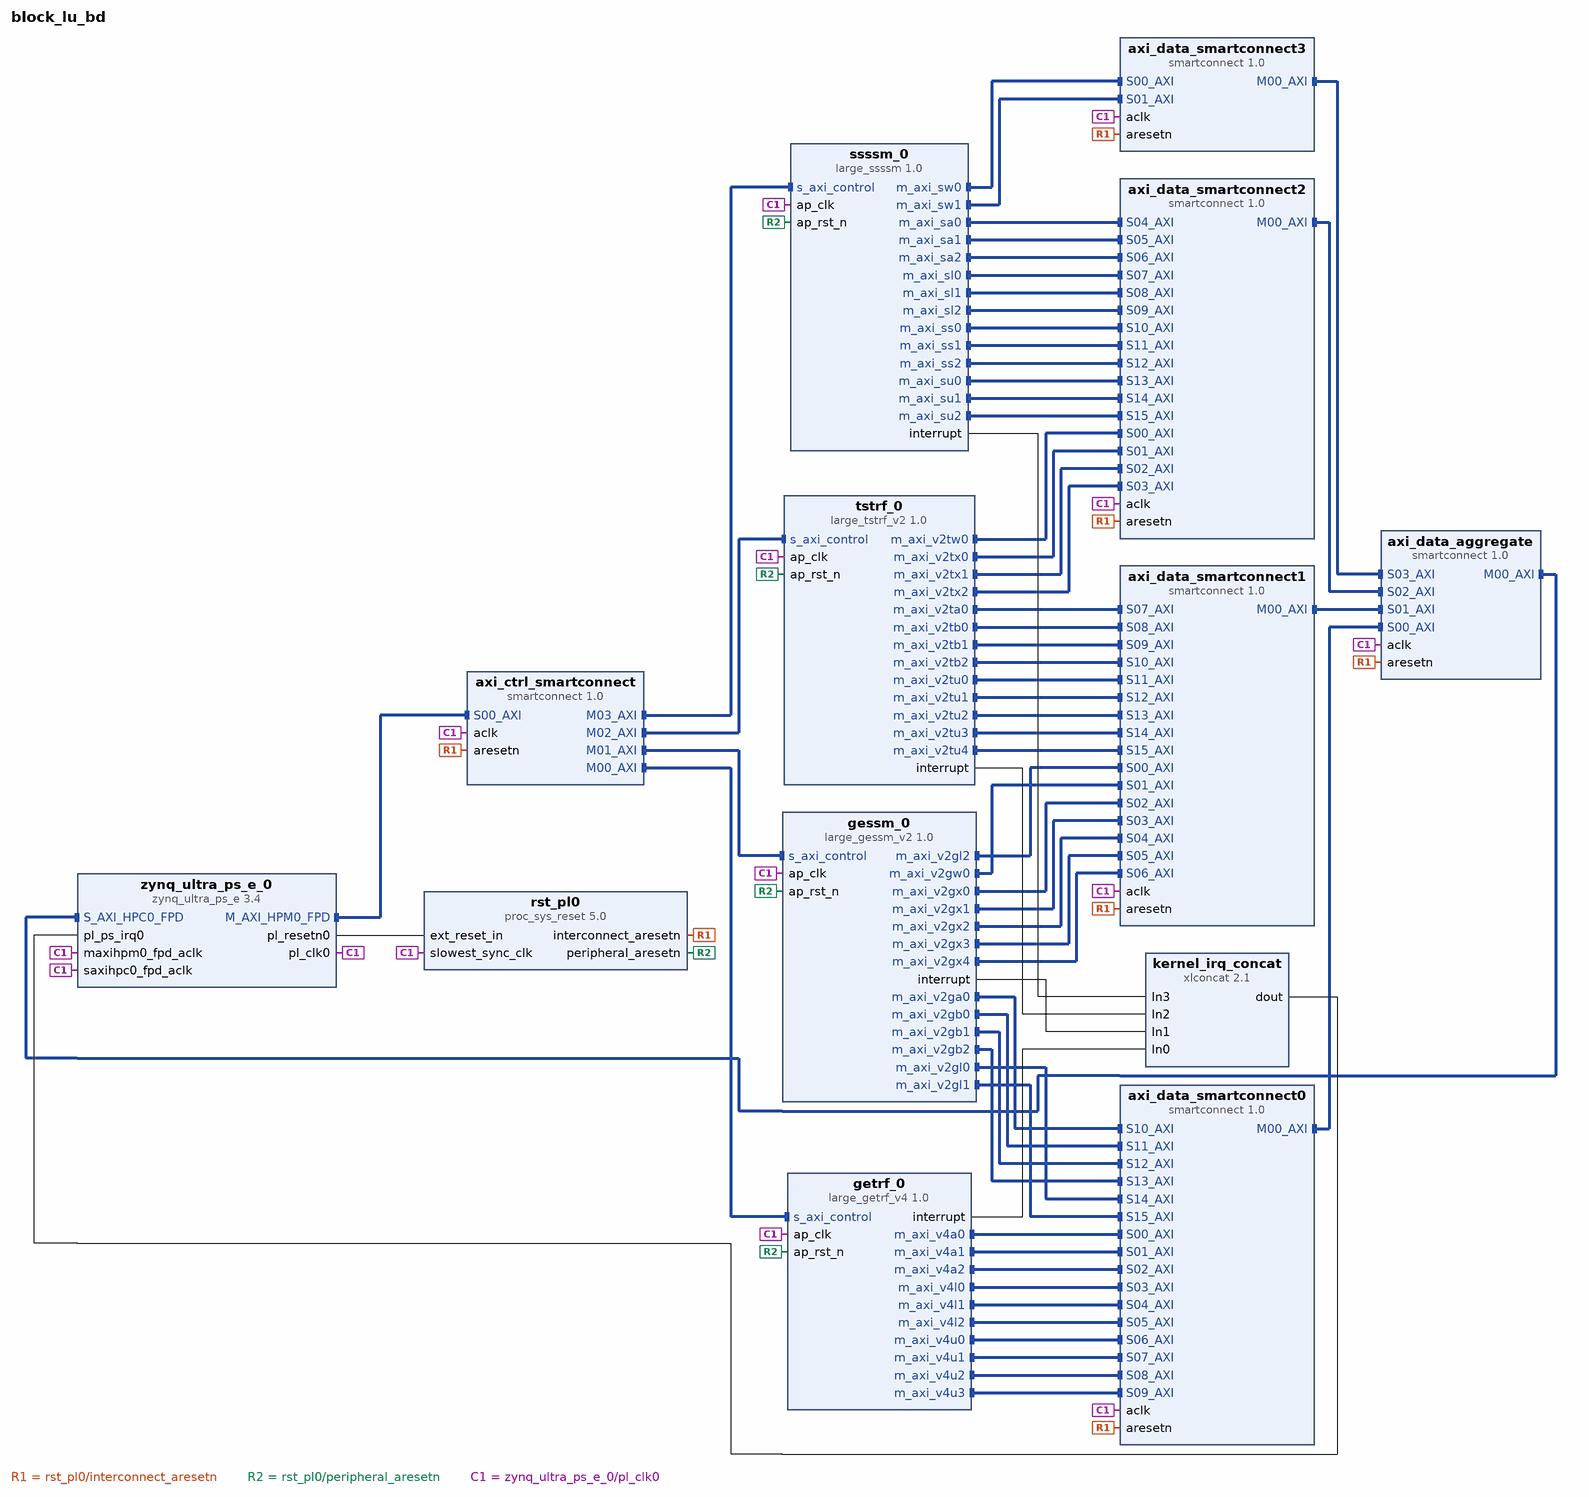
[diagram p0: block diagram of the top level]
# Vivado block design block_lu_bd, xczu15eg-ffvb1156-2-i, Vivado 2022.2
create_bd_design block_lu_bd

create_bd_cell -type ip -vlnv xilinx.com:ip:zynq_ultra_ps_e:3.4 zynq_ultra_ps_e_0
set_property -dict [list \
  CONFIG.PSU__CRL_APB__PL0_REF_CTRL__FREQMHZ 100 \
  CONFIG.PSU__DDR_HIGH_ADDRESS_GUI_ENABLE 0 \
  CONFIG.PSU__MAXIGP0__DATA_WIDTH 128 \
  CONFIG.PSU__UART0__BAUD_RATE 115200 \
  CONFIG.PSU__UART0__MODEM__ENABLE 0 \
  CONFIG.PSU__UART0__PERIPHERAL__ENABLE 1 \
  CONFIG.PSU__UART0__PERIPHERAL__IO {MIO 14 .. 15} \
  CONFIG.PSU__USE__IRQ0 1 \
  CONFIG.PSU__USE__M_AXI_GP0 1 \
  CONFIG.PSU__USE__M_AXI_GP1 0 \
  CONFIG.PSU__USE__M_AXI_GP2 0 \
  CONFIG.PSU__USE__S_AXI_GP0 1 \
] [get_bd_cells zynq_ultra_ps_e_0]
# 34 more settings of zynq_ultra_ps_e_0 are not shown: defaults, MIO pin electricals, DDR timing, and values the tool derives
create_bd_cell -type ip -vlnv xilinx.com:ip:proc_sys_reset:5.0 rst_pl0
create_bd_cell -type ip -vlnv xilinx.com:ip:smartconnect:1.0 axi_ctrl_smartconnect
set_property -dict {CONFIG.NUM_MI 4 CONFIG.NUM_SI 1} [get_bd_cells axi_ctrl_smartconnect]
create_bd_cell -type ip -vlnv xilinx.com:ip:smartconnect:1.0 axi_data_smartconnect0
set_property -dict {CONFIG.NUM_MI 1 CONFIG.NUM_SI 16} [get_bd_cells axi_data_smartconnect0]
create_bd_cell -type ip -vlnv xilinx.com:ip:smartconnect:1.0 axi_data_smartconnect1
set_property -dict {CONFIG.NUM_MI 1 CONFIG.NUM_SI 16} [get_bd_cells axi_data_smartconnect1]
create_bd_cell -type ip -vlnv xilinx.com:ip:smartconnect:1.0 axi_data_smartconnect2
set_property -dict {CONFIG.NUM_MI 1 CONFIG.NUM_SI 16} [get_bd_cells axi_data_smartconnect2]
create_bd_cell -type ip -vlnv xilinx.com:ip:smartconnect:1.0 axi_data_smartconnect3
set_property -dict {CONFIG.NUM_MI 1 CONFIG.NUM_SI 16} [get_bd_cells axi_data_smartconnect3]
create_bd_cell -type ip -vlnv xilinx.com:ip:smartconnect:1.0 axi_data_aggregate
set_property -dict {CONFIG.NUM_MI 1 CONFIG.NUM_SI 4} [get_bd_cells axi_data_aggregate]
create_bd_cell -type ip -vlnv xilinx.com:hls:large_getrf_v4:1.0 getrf_0
create_bd_cell -type ip -vlnv xilinx.com:hls:large_gessm_v2:1.0 gessm_0
create_bd_cell -type ip -vlnv xilinx.com:hls:large_tstrf_v2:1.0 tstrf_0
create_bd_cell -type ip -vlnv xilinx.com:hls:large_ssssm:1.0 ssssm_0
create_bd_cell -type ip -vlnv xilinx.com:ip:xlconcat:2.1 kernel_irq_concat
set_property -dict {CONFIG.NUM_PORTS 4} [get_bd_cells kernel_irq_concat]

# ---- connections ----

connect_bd_intf_net [get_bd_intf_pins axi_ctrl_smartconnect/M00_AXI] [get_bd_intf_pins getrf_0/s_axi_control]
connect_bd_intf_net [get_bd_intf_pins axi_ctrl_smartconnect/M01_AXI] [get_bd_intf_pins gessm_0/s_axi_control]
connect_bd_intf_net [get_bd_intf_pins axi_ctrl_smartconnect/M02_AXI] [get_bd_intf_pins tstrf_0/s_axi_control]
connect_bd_intf_net [get_bd_intf_pins axi_ctrl_smartconnect/M03_AXI] [get_bd_intf_pins ssssm_0/s_axi_control]
connect_bd_intf_net [get_bd_intf_pins axi_data_aggregate/M00_AXI] [get_bd_intf_pins zynq_ultra_ps_e_0/S_AXI_HPC0_FPD]
connect_bd_intf_net [get_bd_intf_pins axi_data_smartconnect0/M00_AXI] [get_bd_intf_pins axi_data_aggregate/S00_AXI]
connect_bd_intf_net [get_bd_intf_pins axi_data_smartconnect1/M00_AXI] [get_bd_intf_pins axi_data_aggregate/S01_AXI]
connect_bd_intf_net [get_bd_intf_pins axi_data_smartconnect2/M00_AXI] [get_bd_intf_pins axi_data_aggregate/S02_AXI]
connect_bd_intf_net [get_bd_intf_pins axi_data_smartconnect3/M00_AXI] [get_bd_intf_pins axi_data_aggregate/S03_AXI]
connect_bd_intf_net [get_bd_intf_pins axi_data_smartconnect0/S10_AXI] [get_bd_intf_pins gessm_0/m_axi_v2ga0]
connect_bd_intf_net [get_bd_intf_pins axi_data_smartconnect0/S11_AXI] [get_bd_intf_pins gessm_0/m_axi_v2gb0]
connect_bd_intf_net [get_bd_intf_pins axi_data_smartconnect0/S12_AXI] [get_bd_intf_pins gessm_0/m_axi_v2gb1]
connect_bd_intf_net [get_bd_intf_pins axi_data_smartconnect0/S13_AXI] [get_bd_intf_pins gessm_0/m_axi_v2gb2]
connect_bd_intf_net [get_bd_intf_pins axi_data_smartconnect0/S14_AXI] [get_bd_intf_pins gessm_0/m_axi_v2gl0]
connect_bd_intf_net [get_bd_intf_pins axi_data_smartconnect0/S15_AXI] [get_bd_intf_pins gessm_0/m_axi_v2gl1]
connect_bd_intf_net [get_bd_intf_pins axi_data_smartconnect1/S00_AXI] [get_bd_intf_pins gessm_0/m_axi_v2gl2]
connect_bd_intf_net [get_bd_intf_pins axi_data_smartconnect1/S01_AXI] [get_bd_intf_pins gessm_0/m_axi_v2gw0]
connect_bd_intf_net [get_bd_intf_pins axi_data_smartconnect1/S02_AXI] [get_bd_intf_pins gessm_0/m_axi_v2gx0]
connect_bd_intf_net [get_bd_intf_pins axi_data_smartconnect1/S03_AXI] [get_bd_intf_pins gessm_0/m_axi_v2gx1]
connect_bd_intf_net [get_bd_intf_pins axi_data_smartconnect1/S04_AXI] [get_bd_intf_pins gessm_0/m_axi_v2gx2]
connect_bd_intf_net [get_bd_intf_pins axi_data_smartconnect1/S05_AXI] [get_bd_intf_pins gessm_0/m_axi_v2gx3]
connect_bd_intf_net [get_bd_intf_pins axi_data_smartconnect1/S06_AXI] [get_bd_intf_pins gessm_0/m_axi_v2gx4]
connect_bd_intf_net [get_bd_intf_pins axi_data_smartconnect0/S00_AXI] [get_bd_intf_pins getrf_0/m_axi_v4a0]
connect_bd_intf_net [get_bd_intf_pins axi_data_smartconnect0/S01_AXI] [get_bd_intf_pins getrf_0/m_axi_v4a1]
connect_bd_intf_net [get_bd_intf_pins axi_data_smartconnect0/S02_AXI] [get_bd_intf_pins getrf_0/m_axi_v4a2]
connect_bd_intf_net [get_bd_intf_pins axi_data_smartconnect0/S03_AXI] [get_bd_intf_pins getrf_0/m_axi_v4l0]
connect_bd_intf_net [get_bd_intf_pins axi_data_smartconnect0/S04_AXI] [get_bd_intf_pins getrf_0/m_axi_v4l1]
connect_bd_intf_net [get_bd_intf_pins axi_data_smartconnect0/S05_AXI] [get_bd_intf_pins getrf_0/m_axi_v4l2]
connect_bd_intf_net [get_bd_intf_pins axi_data_smartconnect0/S06_AXI] [get_bd_intf_pins getrf_0/m_axi_v4u0]
connect_bd_intf_net [get_bd_intf_pins axi_data_smartconnect0/S07_AXI] [get_bd_intf_pins getrf_0/m_axi_v4u1]
connect_bd_intf_net [get_bd_intf_pins axi_data_smartconnect0/S08_AXI] [get_bd_intf_pins getrf_0/m_axi_v4u2]
connect_bd_intf_net [get_bd_intf_pins axi_data_smartconnect0/S09_AXI] [get_bd_intf_pins getrf_0/m_axi_v4u3]
connect_bd_intf_net [get_bd_intf_pins axi_data_smartconnect2/S04_AXI] [get_bd_intf_pins ssssm_0/m_axi_sa0]
connect_bd_intf_net [get_bd_intf_pins axi_data_smartconnect2/S05_AXI] [get_bd_intf_pins ssssm_0/m_axi_sa1]
connect_bd_intf_net [get_bd_intf_pins axi_data_smartconnect2/S06_AXI] [get_bd_intf_pins ssssm_0/m_axi_sa2]
connect_bd_intf_net [get_bd_intf_pins axi_data_smartconnect2/S07_AXI] [get_bd_intf_pins ssssm_0/m_axi_sl0]
connect_bd_intf_net [get_bd_intf_pins axi_data_smartconnect2/S08_AXI] [get_bd_intf_pins ssssm_0/m_axi_sl1]
connect_bd_intf_net [get_bd_intf_pins axi_data_smartconnect2/S09_AXI] [get_bd_intf_pins ssssm_0/m_axi_sl2]
connect_bd_intf_net [get_bd_intf_pins axi_data_smartconnect2/S10_AXI] [get_bd_intf_pins ssssm_0/m_axi_ss0]
connect_bd_intf_net [get_bd_intf_pins axi_data_smartconnect2/S11_AXI] [get_bd_intf_pins ssssm_0/m_axi_ss1]
connect_bd_intf_net [get_bd_intf_pins axi_data_smartconnect2/S12_AXI] [get_bd_intf_pins ssssm_0/m_axi_ss2]
connect_bd_intf_net [get_bd_intf_pins axi_data_smartconnect2/S13_AXI] [get_bd_intf_pins ssssm_0/m_axi_su0]
connect_bd_intf_net [get_bd_intf_pins axi_data_smartconnect2/S14_AXI] [get_bd_intf_pins ssssm_0/m_axi_su1]
connect_bd_intf_net [get_bd_intf_pins axi_data_smartconnect2/S15_AXI] [get_bd_intf_pins ssssm_0/m_axi_su2]
connect_bd_intf_net [get_bd_intf_pins axi_data_smartconnect3/S00_AXI] [get_bd_intf_pins ssssm_0/m_axi_sw0]
connect_bd_intf_net [get_bd_intf_pins axi_data_smartconnect3/S01_AXI] [get_bd_intf_pins ssssm_0/m_axi_sw1]
connect_bd_intf_net [get_bd_intf_pins axi_data_smartconnect1/S07_AXI] [get_bd_intf_pins tstrf_0/m_axi_v2ta0]
connect_bd_intf_net [get_bd_intf_pins axi_data_smartconnect1/S08_AXI] [get_bd_intf_pins tstrf_0/m_axi_v2tb0]
connect_bd_intf_net [get_bd_intf_pins axi_data_smartconnect1/S09_AXI] [get_bd_intf_pins tstrf_0/m_axi_v2tb1]
connect_bd_intf_net [get_bd_intf_pins axi_data_smartconnect1/S10_AXI] [get_bd_intf_pins tstrf_0/m_axi_v2tb2]
connect_bd_intf_net [get_bd_intf_pins axi_data_smartconnect1/S11_AXI] [get_bd_intf_pins tstrf_0/m_axi_v2tu0]
connect_bd_intf_net [get_bd_intf_pins axi_data_smartconnect1/S12_AXI] [get_bd_intf_pins tstrf_0/m_axi_v2tu1]
connect_bd_intf_net [get_bd_intf_pins axi_data_smartconnect1/S13_AXI] [get_bd_intf_pins tstrf_0/m_axi_v2tu2]
connect_bd_intf_net [get_bd_intf_pins axi_data_smartconnect1/S14_AXI] [get_bd_intf_pins tstrf_0/m_axi_v2tu3]
connect_bd_intf_net [get_bd_intf_pins axi_data_smartconnect1/S15_AXI] [get_bd_intf_pins tstrf_0/m_axi_v2tu4]
connect_bd_intf_net [get_bd_intf_pins axi_data_smartconnect2/S00_AXI] [get_bd_intf_pins tstrf_0/m_axi_v2tw0]
connect_bd_intf_net [get_bd_intf_pins axi_data_smartconnect2/S01_AXI] [get_bd_intf_pins tstrf_0/m_axi_v2tx0]
connect_bd_intf_net [get_bd_intf_pins axi_data_smartconnect2/S02_AXI] [get_bd_intf_pins tstrf_0/m_axi_v2tx1]
connect_bd_intf_net [get_bd_intf_pins axi_data_smartconnect2/S03_AXI] [get_bd_intf_pins tstrf_0/m_axi_v2tx2]
connect_bd_intf_net [get_bd_intf_pins zynq_ultra_ps_e_0/M_AXI_HPM0_FPD] [get_bd_intf_pins axi_ctrl_smartconnect/S00_AXI]
connect_bd_net [get_bd_pins gessm_0/interrupt] [get_bd_pins kernel_irq_concat/In1]
connect_bd_net [get_bd_pins getrf_0/interrupt] [get_bd_pins kernel_irq_concat/In0]
connect_bd_net [get_bd_pins kernel_irq_concat/dout] [get_bd_pins zynq_ultra_ps_e_0/pl_ps_irq0]
connect_bd_net [get_bd_pins rst_pl0/interconnect_aresetn] \
  [get_bd_pins axi_ctrl_smartconnect/aresetn] [get_bd_pins axi_data_aggregate/aresetn] \
  [get_bd_pins axi_data_smartconnect0/aresetn] [get_bd_pins axi_data_smartconnect1/aresetn] \
  [get_bd_pins axi_data_smartconnect2/aresetn] [get_bd_pins axi_data_smartconnect3/aresetn]
connect_bd_net [get_bd_pins rst_pl0/peripheral_aresetn] \
  [get_bd_pins getrf_0/ap_rst_n] [get_bd_pins gessm_0/ap_rst_n] [get_bd_pins tstrf_0/ap_rst_n] [get_bd_pins ssssm_0/ap_rst_n]
connect_bd_net [get_bd_pins ssssm_0/interrupt] [get_bd_pins kernel_irq_concat/In3]
connect_bd_net [get_bd_pins tstrf_0/interrupt] [get_bd_pins kernel_irq_concat/In2]
connect_bd_net [get_bd_pins zynq_ultra_ps_e_0/pl_clk0] \
  [get_bd_pins rst_pl0/slowest_sync_clk] [get_bd_pins getrf_0/ap_clk] [get_bd_pins gessm_0/ap_clk] \
  [get_bd_pins tstrf_0/ap_clk] [get_bd_pins ssssm_0/ap_clk] [get_bd_pins axi_ctrl_smartconnect/aclk] \
  [get_bd_pins zynq_ultra_ps_e_0/maxihpm0_fpd_aclk] [get_bd_pins zynq_ultra_ps_e_0/saxihpc0_fpd_aclk] \
  [get_bd_pins axi_data_aggregate/aclk] [get_bd_pins axi_data_smartconnect0/aclk] [get_bd_pins axi_data_smartconnect1/aclk] \
  [get_bd_pins axi_data_smartconnect2/aclk] [get_bd_pins axi_data_smartconnect3/aclk]
connect_bd_net [get_bd_pins zynq_ultra_ps_e_0/pl_resetn0] [get_bd_pins rst_pl0/ext_reset_in]

# ---- address map ----
assign_bd_address -offset 0x0000000000000000 -range 2G -target_address_space [get_bd_addr_spaces gessm_0/m_axi_v2ga0] [get_bd_addr_segs zynq_ultra_ps_e_0/SAXIGP0/HPC0_DDR_LOW]
assign_bd_address -offset 0x00000000FF000000 -range 16M -target_address_space [get_bd_addr_spaces gessm_0/m_axi_v2ga0] [get_bd_addr_segs zynq_ultra_ps_e_0/SAXIGP0/HPC0_LPS_OCM]
assign_bd_address -offset 0x0000000000000000 -range 2G -target_address_space [get_bd_addr_spaces gessm_0/m_axi_v2gb0] [get_bd_addr_segs zynq_ultra_ps_e_0/SAXIGP0/HPC0_DDR_LOW]
assign_bd_address -offset 0x00000000FF000000 -range 16M -target_address_space [get_bd_addr_spaces gessm_0/m_axi_v2gb0] [get_bd_addr_segs zynq_ultra_ps_e_0/SAXIGP0/HPC0_LPS_OCM]
assign_bd_address -offset 0x0000000000000000 -range 2G -target_address_space [get_bd_addr_spaces gessm_0/m_axi_v2gb1] [get_bd_addr_segs zynq_ultra_ps_e_0/SAXIGP0/HPC0_DDR_LOW]
assign_bd_address -offset 0x00000000FF000000 -range 16M -target_address_space [get_bd_addr_spaces gessm_0/m_axi_v2gb1] [get_bd_addr_segs zynq_ultra_ps_e_0/SAXIGP0/HPC0_LPS_OCM]
assign_bd_address -offset 0x0000000000000000 -range 2G -target_address_space [get_bd_addr_spaces gessm_0/m_axi_v2gb2] [get_bd_addr_segs zynq_ultra_ps_e_0/SAXIGP0/HPC0_DDR_LOW]
assign_bd_address -offset 0x00000000FF000000 -range 16M -target_address_space [get_bd_addr_spaces gessm_0/m_axi_v2gb2] [get_bd_addr_segs zynq_ultra_ps_e_0/SAXIGP0/HPC0_LPS_OCM]
assign_bd_address -offset 0x0000000000000000 -range 2G -target_address_space [get_bd_addr_spaces gessm_0/m_axi_v2gl0] [get_bd_addr_segs zynq_ultra_ps_e_0/SAXIGP0/HPC0_DDR_LOW]
assign_bd_address -offset 0x00000000FF000000 -range 16M -target_address_space [get_bd_addr_spaces gessm_0/m_axi_v2gl0] [get_bd_addr_segs zynq_ultra_ps_e_0/SAXIGP0/HPC0_LPS_OCM]
assign_bd_address -offset 0x0000000000000000 -range 2G -target_address_space [get_bd_addr_spaces gessm_0/m_axi_v2gl1] [get_bd_addr_segs zynq_ultra_ps_e_0/SAXIGP0/HPC0_DDR_LOW]
assign_bd_address -offset 0x00000000FF000000 -range 16M -target_address_space [get_bd_addr_spaces gessm_0/m_axi_v2gl1] [get_bd_addr_segs zynq_ultra_ps_e_0/SAXIGP0/HPC0_LPS_OCM]
assign_bd_address -offset 0x0000000000000000 -range 2G -target_address_space [get_bd_addr_spaces gessm_0/m_axi_v2gl2] [get_bd_addr_segs zynq_ultra_ps_e_0/SAXIGP0/HPC0_DDR_LOW]
assign_bd_address -offset 0x00000000FF000000 -range 16M -target_address_space [get_bd_addr_spaces gessm_0/m_axi_v2gl2] [get_bd_addr_segs zynq_ultra_ps_e_0/SAXIGP0/HPC0_LPS_OCM]
assign_bd_address -offset 0x0000000000000000 -range 2G -target_address_space [get_bd_addr_spaces gessm_0/m_axi_v2gw0] [get_bd_addr_segs zynq_ultra_ps_e_0/SAXIGP0/HPC0_DDR_LOW]
assign_bd_address -offset 0x00000000FF000000 -range 16M -target_address_space [get_bd_addr_spaces gessm_0/m_axi_v2gw0] [get_bd_addr_segs zynq_ultra_ps_e_0/SAXIGP0/HPC0_LPS_OCM]
assign_bd_address -offset 0x0000000000000000 -range 2G -target_address_space [get_bd_addr_spaces gessm_0/m_axi_v2gx0] [get_bd_addr_segs zynq_ultra_ps_e_0/SAXIGP0/HPC0_DDR_LOW]
assign_bd_address -offset 0x00000000FF000000 -range 16M -target_address_space [get_bd_addr_spaces gessm_0/m_axi_v2gx0] [get_bd_addr_segs zynq_ultra_ps_e_0/SAXIGP0/HPC0_LPS_OCM]
assign_bd_address -offset 0x0000000000000000 -range 2G -target_address_space [get_bd_addr_spaces gessm_0/m_axi_v2gx1] [get_bd_addr_segs zynq_ultra_ps_e_0/SAXIGP0/HPC0_DDR_LOW]
assign_bd_address -offset 0x00000000FF000000 -range 16M -target_address_space [get_bd_addr_spaces gessm_0/m_axi_v2gx1] [get_bd_addr_segs zynq_ultra_ps_e_0/SAXIGP0/HPC0_LPS_OCM]
assign_bd_address -offset 0x0000000000000000 -range 2G -target_address_space [get_bd_addr_spaces gessm_0/m_axi_v2gx2] [get_bd_addr_segs zynq_ultra_ps_e_0/SAXIGP0/HPC0_DDR_LOW]
assign_bd_address -offset 0x00000000FF000000 -range 16M -target_address_space [get_bd_addr_spaces gessm_0/m_axi_v2gx2] [get_bd_addr_segs zynq_ultra_ps_e_0/SAXIGP0/HPC0_LPS_OCM]
assign_bd_address -offset 0x0000000000000000 -range 2G -target_address_space [get_bd_addr_spaces gessm_0/m_axi_v2gx3] [get_bd_addr_segs zynq_ultra_ps_e_0/SAXIGP0/HPC0_DDR_LOW]
assign_bd_address -offset 0x00000000FF000000 -range 16M -target_address_space [get_bd_addr_spaces gessm_0/m_axi_v2gx3] [get_bd_addr_segs zynq_ultra_ps_e_0/SAXIGP0/HPC0_LPS_OCM]
assign_bd_address -offset 0x0000000000000000 -range 2G -target_address_space [get_bd_addr_spaces gessm_0/m_axi_v2gx4] [get_bd_addr_segs zynq_ultra_ps_e_0/SAXIGP0/HPC0_DDR_LOW]
assign_bd_address -offset 0x00000000FF000000 -range 16M -target_address_space [get_bd_addr_spaces gessm_0/m_axi_v2gx4] [get_bd_addr_segs zynq_ultra_ps_e_0/SAXIGP0/HPC0_LPS_OCM]
assign_bd_address -offset 0x0000000000000000 -range 2G -target_address_space [get_bd_addr_spaces getrf_0/m_axi_v4a0] [get_bd_addr_segs zynq_ultra_ps_e_0/SAXIGP0/HPC0_DDR_LOW]
assign_bd_address -offset 0x00000000FF000000 -range 16M -target_address_space [get_bd_addr_spaces getrf_0/m_axi_v4a0] [get_bd_addr_segs zynq_ultra_ps_e_0/SAXIGP0/HPC0_LPS_OCM]
assign_bd_address -offset 0x0000000000000000 -range 2G -target_address_space [get_bd_addr_spaces getrf_0/m_axi_v4a1] [get_bd_addr_segs zynq_ultra_ps_e_0/SAXIGP0/HPC0_DDR_LOW]
assign_bd_address -offset 0x00000000FF000000 -range 16M -target_address_space [get_bd_addr_spaces getrf_0/m_axi_v4a1] [get_bd_addr_segs zynq_ultra_ps_e_0/SAXIGP0/HPC0_LPS_OCM]
assign_bd_address -offset 0x0000000000000000 -range 2G -target_address_space [get_bd_addr_spaces getrf_0/m_axi_v4a2] [get_bd_addr_segs zynq_ultra_ps_e_0/SAXIGP0/HPC0_DDR_LOW]
assign_bd_address -offset 0x00000000FF000000 -range 16M -target_address_space [get_bd_addr_spaces getrf_0/m_axi_v4a2] [get_bd_addr_segs zynq_ultra_ps_e_0/SAXIGP0/HPC0_LPS_OCM]
assign_bd_address -offset 0x0000000000000000 -range 2G -target_address_space [get_bd_addr_spaces getrf_0/m_axi_v4l0] [get_bd_addr_segs zynq_ultra_ps_e_0/SAXIGP0/HPC0_DDR_LOW]
assign_bd_address -offset 0x00000000FF000000 -range 16M -target_address_space [get_bd_addr_spaces getrf_0/m_axi_v4l0] [get_bd_addr_segs zynq_ultra_ps_e_0/SAXIGP0/HPC0_LPS_OCM]
assign_bd_address -offset 0x0000000000000000 -range 2G -target_address_space [get_bd_addr_spaces getrf_0/m_axi_v4l1] [get_bd_addr_segs zynq_ultra_ps_e_0/SAXIGP0/HPC0_DDR_LOW]
assign_bd_address -offset 0x00000000FF000000 -range 16M -target_address_space [get_bd_addr_spaces getrf_0/m_axi_v4l1] [get_bd_addr_segs zynq_ultra_ps_e_0/SAXIGP0/HPC0_LPS_OCM]
assign_bd_address -offset 0x0000000000000000 -range 2G -target_address_space [get_bd_addr_spaces getrf_0/m_axi_v4l2] [get_bd_addr_segs zynq_ultra_ps_e_0/SAXIGP0/HPC0_DDR_LOW]
assign_bd_address -offset 0x00000000FF000000 -range 16M -target_address_space [get_bd_addr_spaces getrf_0/m_axi_v4l2] [get_bd_addr_segs zynq_ultra_ps_e_0/SAXIGP0/HPC0_LPS_OCM]
assign_bd_address -offset 0x0000000000000000 -range 2G -target_address_space [get_bd_addr_spaces getrf_0/m_axi_v4u0] [get_bd_addr_segs zynq_ultra_ps_e_0/SAXIGP0/HPC0_DDR_LOW]
assign_bd_address -offset 0x00000000FF000000 -range 16M -target_address_space [get_bd_addr_spaces getrf_0/m_axi_v4u0] [get_bd_addr_segs zynq_ultra_ps_e_0/SAXIGP0/HPC0_LPS_OCM]
assign_bd_address -offset 0x0000000000000000 -range 2G -target_address_space [get_bd_addr_spaces getrf_0/m_axi_v4u1] [get_bd_addr_segs zynq_ultra_ps_e_0/SAXIGP0/HPC0_DDR_LOW]
assign_bd_address -offset 0x00000000FF000000 -range 16M -target_address_space [get_bd_addr_spaces getrf_0/m_axi_v4u1] [get_bd_addr_segs zynq_ultra_ps_e_0/SAXIGP0/HPC0_LPS_OCM]
assign_bd_address -offset 0x0000000000000000 -range 2G -target_address_space [get_bd_addr_spaces getrf_0/m_axi_v4u2] [get_bd_addr_segs zynq_ultra_ps_e_0/SAXIGP0/HPC0_DDR_LOW]
assign_bd_address -offset 0x00000000FF000000 -range 16M -target_address_space [get_bd_addr_spaces getrf_0/m_axi_v4u2] [get_bd_addr_segs zynq_ultra_ps_e_0/SAXIGP0/HPC0_LPS_OCM]
assign_bd_address -offset 0x0000000000000000 -range 2G -target_address_space [get_bd_addr_spaces getrf_0/m_axi_v4u3] [get_bd_addr_segs zynq_ultra_ps_e_0/SAXIGP0/HPC0_DDR_LOW]
assign_bd_address -offset 0x00000000FF000000 -range 16M -target_address_space [get_bd_addr_spaces getrf_0/m_axi_v4u3] [get_bd_addr_segs zynq_ultra_ps_e_0/SAXIGP0/HPC0_LPS_OCM]
assign_bd_address -offset 0x0000000000000000 -range 2G -target_address_space [get_bd_addr_spaces ssssm_0/m_axi_sa0] [get_bd_addr_segs zynq_ultra_ps_e_0/SAXIGP0/HPC0_DDR_LOW]
assign_bd_address -offset 0x00000000FF000000 -range 16M -target_address_space [get_bd_addr_spaces ssssm_0/m_axi_sa0] [get_bd_addr_segs zynq_ultra_ps_e_0/SAXIGP0/HPC0_LPS_OCM]
assign_bd_address -offset 0x0000000000000000 -range 2G -target_address_space [get_bd_addr_spaces ssssm_0/m_axi_sa1] [get_bd_addr_segs zynq_ultra_ps_e_0/SAXIGP0/HPC0_DDR_LOW]
assign_bd_address -offset 0x00000000FF000000 -range 16M -target_address_space [get_bd_addr_spaces ssssm_0/m_axi_sa1] [get_bd_addr_segs zynq_ultra_ps_e_0/SAXIGP0/HPC0_LPS_OCM]
assign_bd_address -offset 0x0000000000000000 -range 2G -target_address_space [get_bd_addr_spaces ssssm_0/m_axi_sa2] [get_bd_addr_segs zynq_ultra_ps_e_0/SAXIGP0/HPC0_DDR_LOW]
assign_bd_address -offset 0x00000000FF000000 -range 16M -target_address_space [get_bd_addr_spaces ssssm_0/m_axi_sa2] [get_bd_addr_segs zynq_ultra_ps_e_0/SAXIGP0/HPC0_LPS_OCM]
assign_bd_address -offset 0x0000000000000000 -range 2G -target_address_space [get_bd_addr_spaces ssssm_0/m_axi_sl0] [get_bd_addr_segs zynq_ultra_ps_e_0/SAXIGP0/HPC0_DDR_LOW]
assign_bd_address -offset 0x00000000FF000000 -range 16M -target_address_space [get_bd_addr_spaces ssssm_0/m_axi_sl0] [get_bd_addr_segs zynq_ultra_ps_e_0/SAXIGP0/HPC0_LPS_OCM]
assign_bd_address -offset 0x0000000000000000 -range 2G -target_address_space [get_bd_addr_spaces ssssm_0/m_axi_sl1] [get_bd_addr_segs zynq_ultra_ps_e_0/SAXIGP0/HPC0_DDR_LOW]
assign_bd_address -offset 0x00000000FF000000 -range 16M -target_address_space [get_bd_addr_spaces ssssm_0/m_axi_sl1] [get_bd_addr_segs zynq_ultra_ps_e_0/SAXIGP0/HPC0_LPS_OCM]
assign_bd_address -offset 0x0000000000000000 -range 2G -target_address_space [get_bd_addr_spaces ssssm_0/m_axi_sl2] [get_bd_addr_segs zynq_ultra_ps_e_0/SAXIGP0/HPC0_DDR_LOW]
assign_bd_address -offset 0x00000000FF000000 -range 16M -target_address_space [get_bd_addr_spaces ssssm_0/m_axi_sl2] [get_bd_addr_segs zynq_ultra_ps_e_0/SAXIGP0/HPC0_LPS_OCM]
assign_bd_address -offset 0x0000000000000000 -range 2G -target_address_space [get_bd_addr_spaces ssssm_0/m_axi_ss0] [get_bd_addr_segs zynq_ultra_ps_e_0/SAXIGP0/HPC0_DDR_LOW]
assign_bd_address -offset 0x00000000FF000000 -range 16M -target_address_space [get_bd_addr_spaces ssssm_0/m_axi_ss0] [get_bd_addr_segs zynq_ultra_ps_e_0/SAXIGP0/HPC0_LPS_OCM]
assign_bd_address -offset 0x0000000000000000 -range 2G -target_address_space [get_bd_addr_spaces ssssm_0/m_axi_ss1] [get_bd_addr_segs zynq_ultra_ps_e_0/SAXIGP0/HPC0_DDR_LOW]
assign_bd_address -offset 0x00000000FF000000 -range 16M -target_address_space [get_bd_addr_spaces ssssm_0/m_axi_ss1] [get_bd_addr_segs zynq_ultra_ps_e_0/SAXIGP0/HPC0_LPS_OCM]
assign_bd_address -offset 0x0000000000000000 -range 2G -target_address_space [get_bd_addr_spaces ssssm_0/m_axi_ss2] [get_bd_addr_segs zynq_ultra_ps_e_0/SAXIGP0/HPC0_DDR_LOW]
assign_bd_address -offset 0x00000000FF000000 -range 16M -target_address_space [get_bd_addr_spaces ssssm_0/m_axi_ss2] [get_bd_addr_segs zynq_ultra_ps_e_0/SAXIGP0/HPC0_LPS_OCM]
assign_bd_address -offset 0x0000000000000000 -range 2G -target_address_space [get_bd_addr_spaces ssssm_0/m_axi_su0] [get_bd_addr_segs zynq_ultra_ps_e_0/SAXIGP0/HPC0_DDR_LOW]
assign_bd_address -offset 0x00000000FF000000 -range 16M -target_address_space [get_bd_addr_spaces ssssm_0/m_axi_su0] [get_bd_addr_segs zynq_ultra_ps_e_0/SAXIGP0/HPC0_LPS_OCM]
assign_bd_address -offset 0x0000000000000000 -range 2G -target_address_space [get_bd_addr_spaces ssssm_0/m_axi_su1] [get_bd_addr_segs zynq_ultra_ps_e_0/SAXIGP0/HPC0_DDR_LOW]
assign_bd_address -offset 0x00000000FF000000 -range 16M -target_address_space [get_bd_addr_spaces ssssm_0/m_axi_su1] [get_bd_addr_segs zynq_ultra_ps_e_0/SAXIGP0/HPC0_LPS_OCM]
assign_bd_address -offset 0x0000000000000000 -range 2G -target_address_space [get_bd_addr_spaces ssssm_0/m_axi_su2] [get_bd_addr_segs zynq_ultra_ps_e_0/SAXIGP0/HPC0_DDR_LOW]
assign_bd_address -offset 0x00000000FF000000 -range 16M -target_address_space [get_bd_addr_spaces ssssm_0/m_axi_su2] [get_bd_addr_segs zynq_ultra_ps_e_0/SAXIGP0/HPC0_LPS_OCM]
assign_bd_address -offset 0x0000000000000000 -range 2G -target_address_space [get_bd_addr_spaces ssssm_0/m_axi_sw0] [get_bd_addr_segs zynq_ultra_ps_e_0/SAXIGP0/HPC0_DDR_LOW]
assign_bd_address -offset 0x00000000FF000000 -range 16M -target_address_space [get_bd_addr_spaces ssssm_0/m_axi_sw0] [get_bd_addr_segs zynq_ultra_ps_e_0/SAXIGP0/HPC0_LPS_OCM]
assign_bd_address -offset 0x0000000000000000 -range 2G -target_address_space [get_bd_addr_spaces ssssm_0/m_axi_sw1] [get_bd_addr_segs zynq_ultra_ps_e_0/SAXIGP0/HPC0_DDR_LOW]
assign_bd_address -offset 0x00000000FF000000 -range 16M -target_address_space [get_bd_addr_spaces ssssm_0/m_axi_sw1] [get_bd_addr_segs zynq_ultra_ps_e_0/SAXIGP0/HPC0_LPS_OCM]
assign_bd_address -offset 0x0000000000000000 -range 2G -target_address_space [get_bd_addr_spaces tstrf_0/m_axi_v2ta0] [get_bd_addr_segs zynq_ultra_ps_e_0/SAXIGP0/HPC0_DDR_LOW]
assign_bd_address -offset 0x00000000FF000000 -range 16M -target_address_space [get_bd_addr_spaces tstrf_0/m_axi_v2ta0] [get_bd_addr_segs zynq_ultra_ps_e_0/SAXIGP0/HPC0_LPS_OCM]
assign_bd_address -offset 0x0000000000000000 -range 2G -target_address_space [get_bd_addr_spaces tstrf_0/m_axi_v2tb0] [get_bd_addr_segs zynq_ultra_ps_e_0/SAXIGP0/HPC0_DDR_LOW]
assign_bd_address -offset 0x00000000FF000000 -range 16M -target_address_space [get_bd_addr_spaces tstrf_0/m_axi_v2tb0] [get_bd_addr_segs zynq_ultra_ps_e_0/SAXIGP0/HPC0_LPS_OCM]
assign_bd_address -offset 0x0000000000000000 -range 2G -target_address_space [get_bd_addr_spaces tstrf_0/m_axi_v2tb1] [get_bd_addr_segs zynq_ultra_ps_e_0/SAXIGP0/HPC0_DDR_LOW]
assign_bd_address -offset 0x00000000FF000000 -range 16M -target_address_space [get_bd_addr_spaces tstrf_0/m_axi_v2tb1] [get_bd_addr_segs zynq_ultra_ps_e_0/SAXIGP0/HPC0_LPS_OCM]
assign_bd_address -offset 0x0000000000000000 -range 2G -target_address_space [get_bd_addr_spaces tstrf_0/m_axi_v2tb2] [get_bd_addr_segs zynq_ultra_ps_e_0/SAXIGP0/HPC0_DDR_LOW]
assign_bd_address -offset 0x00000000FF000000 -range 16M -target_address_space [get_bd_addr_spaces tstrf_0/m_axi_v2tb2] [get_bd_addr_segs zynq_ultra_ps_e_0/SAXIGP0/HPC0_LPS_OCM]
assign_bd_address -offset 0x0000000000000000 -range 2G -target_address_space [get_bd_addr_spaces tstrf_0/m_axi_v2tu0] [get_bd_addr_segs zynq_ultra_ps_e_0/SAXIGP0/HPC0_DDR_LOW]
assign_bd_address -offset 0x00000000FF000000 -range 16M -target_address_space [get_bd_addr_spaces tstrf_0/m_axi_v2tu0] [get_bd_addr_segs zynq_ultra_ps_e_0/SAXIGP0/HPC0_LPS_OCM]
assign_bd_address -offset 0x0000000000000000 -range 2G -target_address_space [get_bd_addr_spaces tstrf_0/m_axi_v2tu1] [get_bd_addr_segs zynq_ultra_ps_e_0/SAXIGP0/HPC0_DDR_LOW]
assign_bd_address -offset 0x00000000FF000000 -range 16M -target_address_space [get_bd_addr_spaces tstrf_0/m_axi_v2tu1] [get_bd_addr_segs zynq_ultra_ps_e_0/SAXIGP0/HPC0_LPS_OCM]
assign_bd_address -offset 0x0000000000000000 -range 2G -target_address_space [get_bd_addr_spaces tstrf_0/m_axi_v2tu2] [get_bd_addr_segs zynq_ultra_ps_e_0/SAXIGP0/HPC0_DDR_LOW]
assign_bd_address -offset 0x00000000FF000000 -range 16M -target_address_space [get_bd_addr_spaces tstrf_0/m_axi_v2tu2] [get_bd_addr_segs zynq_ultra_ps_e_0/SAXIGP0/HPC0_LPS_OCM]
assign_bd_address -offset 0x0000000000000000 -range 2G -target_address_space [get_bd_addr_spaces tstrf_0/m_axi_v2tu3] [get_bd_addr_segs zynq_ultra_ps_e_0/SAXIGP0/HPC0_DDR_LOW]
assign_bd_address -offset 0x00000000FF000000 -range 16M -target_address_space [get_bd_addr_spaces tstrf_0/m_axi_v2tu3] [get_bd_addr_segs zynq_ultra_ps_e_0/SAXIGP0/HPC0_LPS_OCM]
assign_bd_address -offset 0x0000000000000000 -range 2G -target_address_space [get_bd_addr_spaces tstrf_0/m_axi_v2tu4] [get_bd_addr_segs zynq_ultra_ps_e_0/SAXIGP0/HPC0_DDR_LOW]
assign_bd_address -offset 0x00000000FF000000 -range 16M -target_address_space [get_bd_addr_spaces tstrf_0/m_axi_v2tu4] [get_bd_addr_segs zynq_ultra_ps_e_0/SAXIGP0/HPC0_LPS_OCM]
assign_bd_address -offset 0x0000000000000000 -range 2G -target_address_space [get_bd_addr_spaces tstrf_0/m_axi_v2tw0] [get_bd_addr_segs zynq_ultra_ps_e_0/SAXIGP0/HPC0_DDR_LOW]
assign_bd_address -offset 0x00000000FF000000 -range 16M -target_address_space [get_bd_addr_spaces tstrf_0/m_axi_v2tw0] [get_bd_addr_segs zynq_ultra_ps_e_0/SAXIGP0/HPC0_LPS_OCM]
assign_bd_address -offset 0x0000000000000000 -range 2G -target_address_space [get_bd_addr_spaces tstrf_0/m_axi_v2tx0] [get_bd_addr_segs zynq_ultra_ps_e_0/SAXIGP0/HPC0_DDR_LOW]
assign_bd_address -offset 0x00000000FF000000 -range 16M -target_address_space [get_bd_addr_spaces tstrf_0/m_axi_v2tx0] [get_bd_addr_segs zynq_ultra_ps_e_0/SAXIGP0/HPC0_LPS_OCM]
assign_bd_address -offset 0x0000000000000000 -range 2G -target_address_space [get_bd_addr_spaces tstrf_0/m_axi_v2tx1] [get_bd_addr_segs zynq_ultra_ps_e_0/SAXIGP0/HPC0_DDR_LOW]
assign_bd_address -offset 0x00000000FF000000 -range 16M -target_address_space [get_bd_addr_spaces tstrf_0/m_axi_v2tx1] [get_bd_addr_segs zynq_ultra_ps_e_0/SAXIGP0/HPC0_LPS_OCM]
assign_bd_address -offset 0x0000000000000000 -range 2G -target_address_space [get_bd_addr_spaces tstrf_0/m_axi_v2tx2] [get_bd_addr_segs zynq_ultra_ps_e_0/SAXIGP0/HPC0_DDR_LOW]
assign_bd_address -offset 0x00000000FF000000 -range 16M -target_address_space [get_bd_addr_spaces tstrf_0/m_axi_v2tx2] [get_bd_addr_segs zynq_ultra_ps_e_0/SAXIGP0/HPC0_LPS_OCM]
assign_bd_address -offset 0x00A0000000 -range 4K -target_address_space [get_bd_addr_spaces zynq_ultra_ps_e_0/Data] [get_bd_addr_segs gessm_0/s_axi_control/reg0]
assign_bd_address -offset 0x00A0001000 -range 4K -target_address_space [get_bd_addr_spaces zynq_ultra_ps_e_0/Data] [get_bd_addr_segs getrf_0/s_axi_control/reg0]
assign_bd_address -offset 0x00A0002000 -range 4K -target_address_space [get_bd_addr_spaces zynq_ultra_ps_e_0/Data] [get_bd_addr_segs ssssm_0/s_axi_control/reg0]
assign_bd_address -offset 0x00A0003000 -range 4K -target_address_space [get_bd_addr_spaces zynq_ultra_ps_e_0/Data] [get_bd_addr_segs tstrf_0/s_axi_control/reg0]

validate_bd_design
save_bd_design
